# Altium schematic sheet Sch_Z35_Sensors.SchDoc
size A; SheetNumber: 3; SheetTotal: 3
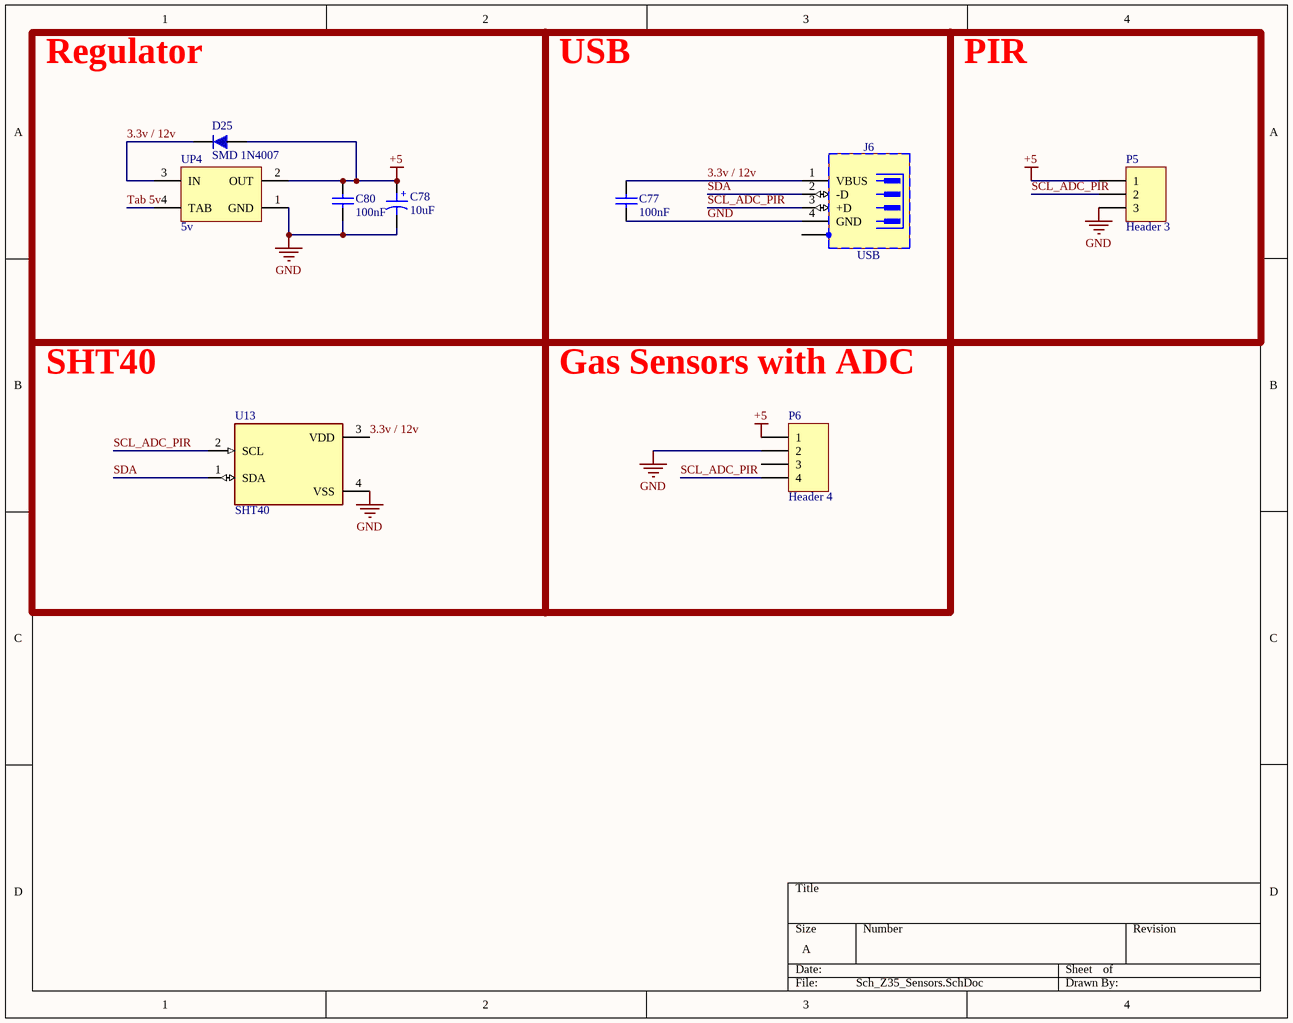
[diagram p0: Sch_Z35_Sensors.SchDoc]

## Parts
C77  100nF  [CAPC3413X12N]
C78  10uF  [Cap electrolitic radial 6.3x12-2.5]
C80  100nF  [CAPC3413X12N]
D25  SMD 1N4007  [DIODE SMD]
J6  USB  [MOLEX_48037-0001]
P5  Header 3  [HDR1X3]
P6  Header 4  [HDR1X4]
U13  SHT40  [SHT4X]
UP4  5v  [SOT223]

## Blocks framed on the sheet
Regulator: C78 C80 D25 UP4

## Nets
+5: C78.1 C80.1 D25.1 P5.1 P6.1 UP4.2(OUT)
GND: C77.2 C78.2 C80.2 J6.4(GND) P5.3 P6.2 U13.4(VSS) UP4.1(GND)
3.3v / 12v: C77.1 D25.2 J6.1(VBUS) U13.3(VDD) UP4.3(IN)
SCL_ADC_PIR: J6.3(+D) P5.2 P6.4 U13.2(SCL)
SDA: J6.2(-D) U13.1(SDA)
Tab 5v: UP4.4(TAB)

Not connected (* = marked no-connect by the designer): J6 5(SHIELD); P6 3

## Notes on the sheet
- USB
- PIR
- SHT40
- Gas Sensors with ADC
- (in symbol Cap ELECTROLITIC TOTAL SIZE) +

## Library data of the parts
C77 C80 = CAP SMD 0805: CAP 0805; Designer: Abbas Basereh; Desc.: CAP SMD 0805; Data: 16-12-2016
C78 = Cap ELECTROLITIC TOTAL SIZE: Cap electrolitic radial; Designer: Abbas Basereh; VALUE: 1uF; Data: 16-12-2016; Part. No: *
D25 = Diode SMD Package: Diode SMD Pakage
J6 = MOLEX_48037-0001: 4 Pin + 1 Shield USB Receptacle; Part Description: Right Angled Through Hole Shielded USB Plug, Type A; Manufacturer: MOLEX; PressFit: No; Part Number: MOLEX_48037-0001; Component Kind: Standard; Component Type: Standard; Pin Count: 6; Family: USB; Mounted: Yes; Socket: No; SMD: No; Sense: No; Status: None; Manufacturer Part Number: 48037-0001; ComponentHeight: 4.6mm; HelpURL: \\cern.ch\dfs\Applications\Altium\Datasheets\MOLEX_48037-0001.pdf; Author: CERN DEM JLC; CreateDate: 8/28/2014; LatestRevisionDate: 8/28/2014
P5 = Header 3: Header, 3-Pin; LatestRevisionDate: 17-Jul-2002; LatestRevisionNote: Re-released for DXP Platform.; Publisher: Altium Limited
P6 = Header 4: Header, 4-Pin; LatestRevisionDate: 17-Jul-2002; LatestRevisionNote: Re-released for DXP Platform.; Publisher: Altium Limited
U13 = SHT4X: Digital Relative Humidity Temperature Sensor, Â±1.8 / max 3.5 %RH, Â±0.2 Â°C, Ultra-Low-Power; MP: SHT40-AD1B-R2; MF: Sensirion; Purchase-URL: https://pricing.snapeda.com/search/part/SHT40-AD1B-R2/?ref=eda; Value: *; Availability: In Stock; Check_prices: https://www.snapeda.com/parts/SHT40-AD1B-R2/Sensirion/view-part/?ref=eda; SnapEDA_Link: https://www.snapeda.com/parts/SHT40-AD1B-R2/Sensirion/view-part/?ref=snap; Price: None; Package: None
UP4 = AMS1117-x.x: x.x Volt, 800mA Low-Dropout Linear Regulator, 4-pin SOT-223; Designer: Ali Hafizi; Data: 16-12-2016